# Altium schematic sheet voltage_regulators_buck.SchDoc
size A4; SheetNumber: 5; SheetTotal: 5
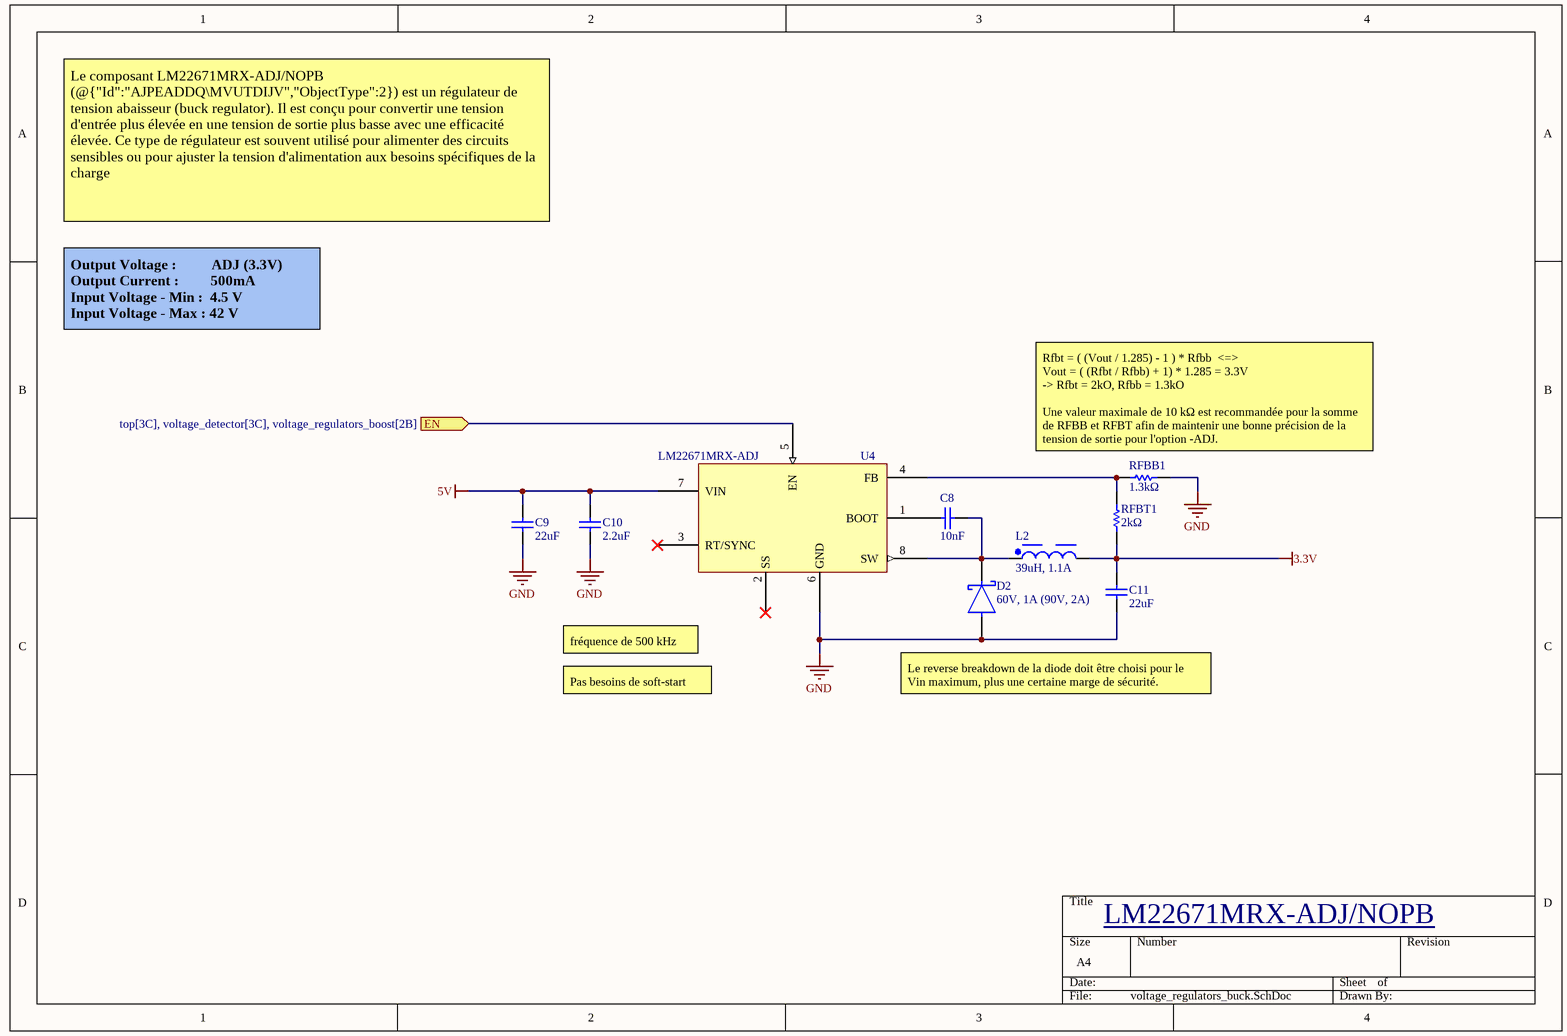
[diagram p0: voltage_regulators_buck.SchDoc]

## Parts
C8  10nF  [CAPC1608X90X35ML10T15]
C9  22uF  [CAPC1608X90X35ML10T15]
C10  2.2uF  [CAPC1608X90X35NL15T15]
C11  22uF  [CAPC1608X90X35ML10T15]
D2  60V, 1A (90V, 2A)  [FP-SMB-MFG]
L2  39uH, 1.1A  [WE-PD_7332R]
RFBB1  1.3kΩ  [RESC1609X50X30NL10T20]
RFBT1  2kΩ  [RESC1608X55X30ML15T15]
U4  LM22671MRX-ADJ  [LM22671MRX-ADJ/NOPB]

## Ports
EN (in, see top[3C], voltage_detector[3C], voltage_regulators_boost[2B])

## Nets
3.3V: C11.2 L2.2 RFBT1.1
5V: C9.2 C10.2 U4.7(VIN)
GND: C9.1 C10.1 C11.1 D2.2(A) RFBB1.2 U4.6(GND)
EN: U4.5(EN) ; port EN
NetC8_1: C8.1 U4.1(BOOT)
NetC8_2: C8.2 D2.1(C) L2.1 U4.8(SW)
NetRFBB1_1: RFBB1.1 RFBT1.2 U4.4(FB)

Not connected (* = marked no-connect by the designer): U4 2(SS)* 3(RT/SYNC)*

## Notes on the sheet
- Le composant LM22671MRX-ADJ/NOPB (@{"Id":"AJPEADDQ\MVUTDIJV","ObjectType":2}) est un régulateur de tension abaisseur (buck regulator). Il est conçu pour convertir une tension d'entrée plus élevée en une tension de sortie plus basse avec une efficacité élevée. Ce type de régulateur est souvent utilisé pour alimenter des circuits sensibles ou pour ajuster la tension d'alimentation aux besoins spécifiques de la charge
- Output Voltage :          ADJ (3.3V)
  Output Current :         500mA
  Input Voltage - Min :  4.5 V
  Input Voltage - Max : 42 V
- (near RFBB1) Rfbt = ( (Vout / 1.285) - 1 ) * Rfbb  <=>
  Vout = ( (Rfbt / Rfbb) + 1) * 1.285 = 3.3V
  -> Rfbt = 2kO, Rfbb = 1.3kO
  Une valeur maximale de 10 kΩ est recommandée pour la somme de RFBB et RFBT afin de maintenir une bonne précision de la tension de sortie pour l'option -ADJ.
- fréquence de 500 kHz
- Pas besoins de soft-start
- Le reverse breakdown de la diode doit être choisi pour le Vin maximum, plus une certaine marge de sécurité.
- LM22671MRX-ADJ/NOPB <https://www.mouser.ch/ProductDetail/Texas-Instruments/LM22671MRX-ADJ-NOPB?qs=X1J7HmVL2ZGHbJs9hwNu1Q%3D%3D>

## Library data of the parts
C8 = CMP-2100-03642-1: Chip Capacitor, 10 nF, +/- 10%, 50 V, -55 to 125 degC, 0603 (1608 Metric), RoHS, Tape and Reel; Manufacturer: Murata; Insulation Resistance: 10GR; Dielectric: X7R; Voltage Rating: 50V; Material: Ceramic; Package Quantity: 1; Lead Free: LeadFree; Case/Package: 0603; Termination: SMD/SMT; REACH SVHC: Unknown; Manufacturer URL: http://www.murata.com/; Datasheet URL: http://search.murata.co.jp/Ceramy/image/img/A01X/G101/ENG/GRM188R71H103KA01-01.pdf; Mount: SurfaceMount; Datasheet Version: 42401.0; Number of Pins: 2; Length: 1.6mm; Voltage: 50V; Depth: 0.8mm; Tolerance: 10%; Min Operating Temperature: -55degC; Voltage Rating (DC): 50V; Max Operating Temperature: 125degC; Package Description: 2-Pin Surface Mount Device, Body 1.6 x 0.8 mm; RoHSCompliant: True; Case Code (Imperial): 0603; Width: 0.031inch; Case Code (Metric): 1608; Height: 0.8mm; Package Reference: 0603; Packaging: TapeandReel; Thickness: 0.035inch; Capacitance: 10nF; Dielectric Material: Ceramic
C9 C11 = CMP-2006-02789-1: Part Number: GRM188R60G226MEA0L; Manufacturer: Murata
C10 = CMP-2006-04537-1: Manufacturer: AVX Interconnect / Elco; Part Number: 0603YD225MAT2A
D2 = CMP-12790-000073-1: DIODE SCHOTTKY 60V 1A SMB; Forward Voltage: 700mV; Capacitance: 110pF; Polarity: Standard; Max Forward Surge Current (Ifsm): 30A; Element Configuration: Single; Peak Reverse Current: 500uA; Height: 2.42mm; Radiation Hardening: No; Length: 4.57mm; Max Repetitive Reverse Voltage (Vrrm): 60V; Current Rating: 1A; Width: 3.94mm; Min Operating Temperature: -65°C; Max Operating Temperature: 150°C; Weight: 0.00328oz; Forward Current: 1A; Number of Pins: 2; Mount: Surface Mount; Lead Free: Lead Free; Case/Package: SMB; Contact Plating: Tin; Voltage Rating (DC): 60V; Average Rectified Current: 1A; Package Quantity: 3000; Max Reverse Voltage (DC): 60V; Output Current: 1A; REACH SVHC: No SVHC; Packaging: Tape and Reel; Termination: SMD/SMT; Peak Non-Repetitive Surge Current: 30A
L2 = CMP-1396-00047-2: NexarPartId: 22866977; Shielding: Shielded; RMS Current (Irms): 1.03A; Tolerance: 20%; Test Frequency: 1kHz; Core Material: Ferrite; DC Resistance (DCR): 209mΩ; Resistance: 320mΩ; Self Resonant Frequency: 15MHz; Inductance: 39µH; Termination: SMD/SMT; Composition: Wirewound; Number of Pins: 2; Ambient Temperature Range Low: -40°C; Max DC Current: 1.03A; Inductance Tolerance: 20%; Length: 7.3mm; Saturation Current: 1.1A; Packaging: Cut Tape (CT); Ambient Temperature Range High: 85°C; Current Rating: 1.03A; Min Operating Temperature: -40°C; Max Operating Temperature: 125°C; Height - Seated (Max): 3.5052mm; Case/Package: Nonstandard; Width: 7.3mm; Height: 3.2mm; Series Resistance: 320mΩ; REACH SVHC: Unknown; RoHS: Compliant; Mount: Surface Mount
RFBB1 = CMP-2000-02988-1: Manufacturer: Vishay Dale; Part Number: CRCW06031K30FKEA
RFBT1 = CMP-2000-00317-1: Part Number: ERJ-3EKF2001V; Manufacturer: Panasonic